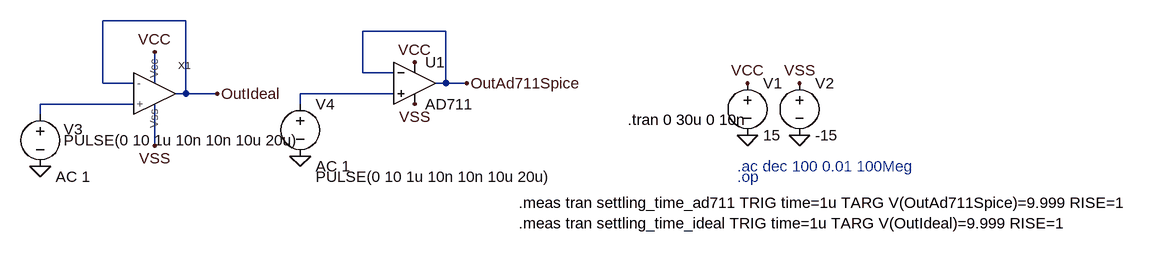
[diagram p0: schematic SettlingTime.asc]
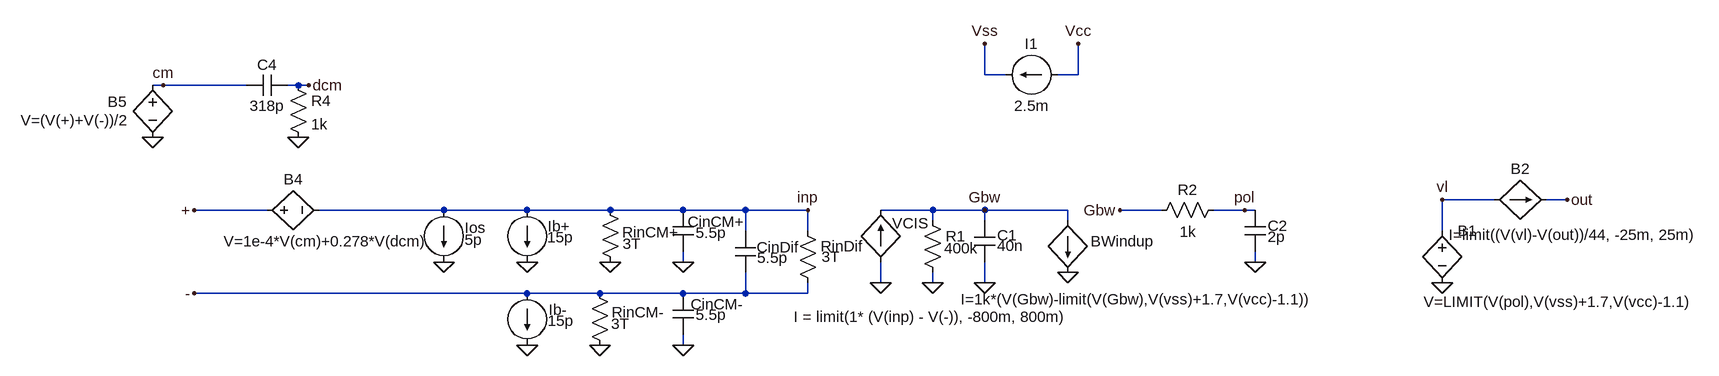
[diagram p1: sub-circuit aoideal.asc]
SettlingTime.asc, the LTspice schematic file:
Version 4.1
SHEET 1 964 680
WIRE -208 112 -336 112
WIRE 192 128 64 128
WIRE 64 192 64 128
WIRE 112 192 64 192
WIRE -336 208 -336 112
WIRE -288 208 -336 208
WIRE -256 208 -256 160
WIRE 192 208 192 128
WIRE 192 208 176 208
WIRE 224 208 192 208
WIRE -208 224 -208 112
WIRE -208 224 -224 224
WIRE -160 224 -208 224
WIRE 112 224 -32 224
WIRE -288 240 -432 240
WIRE -32 240 -32 224
WIRE -432 256 -432 240
WIRE -256 304 -256 240
FLAG 656 288 0
FLAG 736 288 0
FLAG 656 208 VCC
FLAG 736 208 VSS
FLAG 144 176 VCC
FLAG -256 160 VCC
FLAG -256 304 VSS
FLAG 144 240 VSS
FLAG -160 224 OutIdeal
FLAG 224 208 OutAd711Spice
FLAG -432 336 0
FLAG -32 320 0
SYMBOL OpAmps\\AD711 144 144 R0
SYMATTR InstName U1
SYMBOL AoIdeal -288 224 R0
SYMATTR InstName X1
SYMBOL voltage 656 192 R0
SYMATTR InstName V1
SYMATTR Value 15
SYMBOL voltage 736 192 R0
SYMATTR InstName V2
SYMATTR Value -15
SYMBOL voltage -432 240 R0
WINDOW 123 24 112 Left 2
WINDOW 39 0 0 Left 0
WINDOW 0 36 39 Left 2
WINDOW 3 36 56 Left 2
SYMATTR Value2 AC 1
SYMATTR InstName V3
SYMATTR Value PULSE(0 10 1u 10n 10n 10u 20u)
SYMBOL voltage -32 224 R0
WINDOW 123 24 112 Left 2
WINDOW 39 0 0 Left 0
WINDOW 3 24 128 Left 2
SYMATTR Value2 AC 1
SYMATTR Value PULSE(0 10 1u 10n 10n 10u 20u)
SYMATTR InstName V4
TEXT 640 352 Left 2 ;.op
TEXT 640 336 Left 2 ;.ac dec 100 0.01 100Meg
TEXT 472 264 Left 2 !.tran 0 30u 0 10n
TEXT 304 392 Left 2 !.meas tran settling_time_ad711 TRIG time=1u TARG V(OutAd711Spice)=9.999 RISE=1\n.meas tran settling_time_ideal TRIG time=1u TARG V(OutIdeal)=9.999 RISE=1

aoideal.asc, the sub-circuit schematic file:
Version 4.1
SHEET 1 2688 1516
WIRE 272 -128 272 -176
WIRE 304 -128 272 -128
WIRE 416 -128 416 -176
WIRE 416 -128 384 -128
WIRE -992 -112 -1008 -112
WIRE -864 -112 -992 -112
WIRE -784 -112 -800 -112
WIRE -768 -112 -784 -112
WIRE 1056 64 976 64
WIRE 1168 64 1136 64
WIRE -832 80 -944 80
WIRE -560 80 -752 80
WIRE -432 80 -560 80
WIRE -304 80 -432 80
WIRE -192 80 -304 80
WIRE -96 80 -192 80
WIRE 0 80 -96 80
WIRE 192 80 112 80
WIRE 272 80 192 80
WIRE 400 80 272 80
WIRE 544 80 480 80
WIRE 672 80 624 80
WIRE 688 80 672 80
WIRE 192 96 192 80
WIRE 272 96 272 80
WIRE 400 96 400 80
WIRE -96 112 -96 80
WIRE 0 112 0 80
WIRE 976 112 976 64
WIRE -192 160 -192 144
WIRE 688 160 688 144
WIRE 112 192 112 160
WIRE 192 192 192 176
WIRE 272 192 272 160
WIRE -432 208 -944 208
WIRE -320 208 -432 208
WIRE -192 208 -320 208
WIRE -96 208 -96 176
WIRE -96 208 -192 208
WIRE 0 208 0 192
WIRE 0 208 -96 208
WIRE -192 288 -192 272
FLAG 112 192 0
FLAG -944 208 -
FLAG -944 80 +
FLAG 192 192 0
FLAG 272 192 0
FLAG -192 160 0
FLAG -304 160 0
FLAG -432 160 0
FLAG -560 160 0
FLAG -432 288 0
FLAG -320 288 0
FLAG -192 288 0
FLAG 0 80 inp
FLAG 272 80 Gbw
FLAG 480 80 Gbw
FLAG 688 160 0
FLAG 672 80 pol
FLAG 976 192 0
FLAG 416 -176 Vcc
FLAG 272 -176 Vss
FLAG 1168 64 out
FLAG 400 176 0
FLAG 976 64 vl
FLAG -1008 -32 0
FLAG -992 -112 cm
FLAG -768 -112 dcm
FLAG -784 -32 0
SYMBOL bi 112 160 R180
WINDOW 0 -73 60 Left 2
WINDOW 3 -289 -84 Left 2
SYMATTR InstName VCIS
SYMATTR Value I = limit(1* (V(inp) - V(-)), -800m, 800m)
SYMBOL res 176 80 R0
WINDOW 3 34 59 Left 2
SYMATTR Value 400k
SYMATTR InstName R1
SYMBOL cap 256 96 R0
WINDOW 0 35 23 Left 2
WINDOW 3 35 39 Left 2
SYMATTR InstName C1
SYMATTR Value 40n
SYMBOL current -560 80 R0
WINDOW 0 32 27 Left 2
WINDOW 3 32 46 Left 2
SYMATTR InstName Ios
SYMATTR Value 5p
SYMBOL current -432 80 R0
WINDOW 0 32 25 Left 2
WINDOW 3 31 42 Left 2
SYMATTR InstName Ib+
SYMATTR Value 15p
SYMBOL current -432 208 R0
WINDOW 0 33 25 Left 2
WINDOW 3 32 42 Left 2
SYMATTR InstName Ib-
SYMATTR Value 15p
SYMBOL res -320 64 R0
WINDOW 0 34 50 Left 2
WINDOW 3 35 68 Left 2
SYMATTR InstName RinCM+
SYMATTR Value 3T
SYMBOL res -336 192 R0
WINDOW 0 34 45 Left 2
WINDOW 3 33 63 Left 2
SYMATTR InstName RinCM-
SYMATTR Value 3T
SYMBOL cap -208 208 R0
WINDOW 0 28 17 Left 2
WINDOW 3 35 33 Left 2
SYMATTR InstName CinCM-
SYMATTR Value 5.5p
SYMBOL cap -208 80 R0
WINDOW 0 23 18 Left 2
WINDOW 3 35 35 Left 2
SYMATTR InstName CinCM+
SYMATTR Value 5.5p
SYMBOL cap -112 112 R0
WINDOW 0 33 25 Left 2
WINDOW 3 34 41 Left 2
SYMATTR InstName CinDif
SYMATTR Value 5.5p
SYMBOL res -16 96 R0
WINDOW 3 37 56 Left 2
SYMATTR Value 3T
SYMATTR InstName RinDif
SYMBOL res 640 64 R90
WINDOW 0 0 56 VBottom 2
WINDOW 3 34 55 VTop 2
SYMATTR InstName R2
SYMATTR Value 1k
SYMBOL cap 672 80 R0
WINDOW 0 35 24 Left 2
WINDOW 3 35 41 Left 2
SYMATTR InstName C2
SYMATTR Value 2p
SYMBOL bv 976 96 R0
WINDOW 3 -29 125 Left 2
SYMATTR Value V=LIMIT(V(pol),V(vss)+1.7,V(vcc)-1.1)
SYMATTR InstName B1
SYMBOL current 384 -128 R90
WINDOW 0 -32 40 VBottom 2
WINDOW 3 32 40 VTop 2
SYMATTR InstName I1
SYMATTR Value 2.5m
SYMBOL bi 400 96 R0
WINDOW 0 35 32 Left 2
WINDOW 3 -165 121 Left 2
SYMATTR InstName BWindup
SYMATTR Value I=1k*(V(Gbw)-limit(V(Gbw),V(vss)+1.7,V(vcc)-1.1))
SYMBOL bi 1056 64 R270
WINDOW 0 32 40 VTop 2
WINDOW 3 -38 122 VBottom 2
SYMATTR InstName B2
SYMATTR Value I=limit((V(vl)-V(out))/44, -25m, 25m)
SYMBOL bv -848 80 R270
WINDOW 0 32 56 VTop 2
WINDOW 3 -32 106 VBottom 2
SYMATTR InstName B4
SYMATTR Value V=1e-4*V(cm)+0.278*V(dcm)
SYMBOL bv -1008 -128 R0
WINDOW 0 -69 41 Left 2
WINDOW 3 -203 70 Left 2
SYMATTR InstName B5
SYMATTR Value V=(V(+)+V(-))/2
SYMBOL cap -864 -96 R270
WINDOW 0 32 32 VTop 2
WINDOW 3 0 32 VBottom 2
SYMATTR InstName C4
SYMATTR Value 318p
SYMBOL res -800 -128 R0
SYMATTR InstName R4
SYMATTR Value 1k

The netlist it stands for:
* SettlingTime.asc
X§U1 N001 OutAd711Spice VCC VSS OutAd711Spice AD712  ; pins In+ In- V+ V- OUT
X§X1 OutIdeal N002 OutIdeal VCC VSS aoideal
V1 VCC 0 15
V2 VSS 0 -15
V3 N002 0 PULSE(0 10 1u 10n 10n 10u 20u) AC 1
V4 N001 0 PULSE(0 10 1u 10n 10n 10u 20u) AC 1

* block symbol definitions
.subckt aoideal - + Out Vcc Vss
B§VCIS 0 Gbw I = limit(1* (V(inp) - V(-)), -800m, 800m)
R1 Gbw 0 400k
C1 Gbw 0 40n
Ios inp 0 5p
Ib+ inp 0 15p
Ib- - 0 15p
RinCM+ inp 0 3T
RinCM- - 0 3T
CinCM- - 0 5.5p
CinCM+ inp 0 5.5p
CinDif inp - 5.5p
RinDif inp - 3T
R2 pol Gbw 1k
C2 pol 0 2p
B1 vl 0 V=LIMIT(V(pol),V(vss)+1.7,V(vcc)-1.1)
I1 Vcc Vss 2.5m
BWindup Gbw 0 I=1k*(V(Gbw)-limit(V(Gbw),V(vss)+1.7,V(vcc)-1.1))
B2 vl out I=limit((V(vl)-V(out))/44, -25m, 25m)
B4 + inp V=1e-4*V(cm)+0.278*V(dcm)
B5 cm 0 V=(V(+)+V(-))/2
C4 cm dcm 318p
R4 dcm 0 1k
.ends aoideal

* .op
* .ac dec 100 0.01 100Meg
.tran 0 30u 0 10n
.meas tran settling_time_ad711 TRIG time=1u TARG V(OutAd711Spice)=9.999 RISE=1
.meas tran settling_time_ideal TRIG time=1u TARG V(OutIdeal)=9.999 RISE=1
.lib ADI1.lib
.backanno
.end

* Results of the author's LTspice run, read from the files saved beside the schematic
* Operating Point, zero values left out:
*   V(vcc) = 15 V
*   V(vss) = -15 V
*   I(V1) = -7.399 mA
*   I(V2) = 7.399 mA
*   I(V3) = -20 pA
*   I(V4) = -25 pA
*   Ix(u1:1) = 25 pA
*   Ix(u1:2) = 25 pA
*   Ix(u1:3) = 4.899 mA
*   Ix(u1:4) = -4.899 mA
*   Ix(u1:5) = -25 pA
*   Ix(x1:+) = 20 pA
*   Ix(x1:-) = 15 pA
*   Ix(x1:out) = -15 pA
*   Ix(x1:vcc) = 2.5 mA
*   Ix(x1:vss) = -2.5 mA
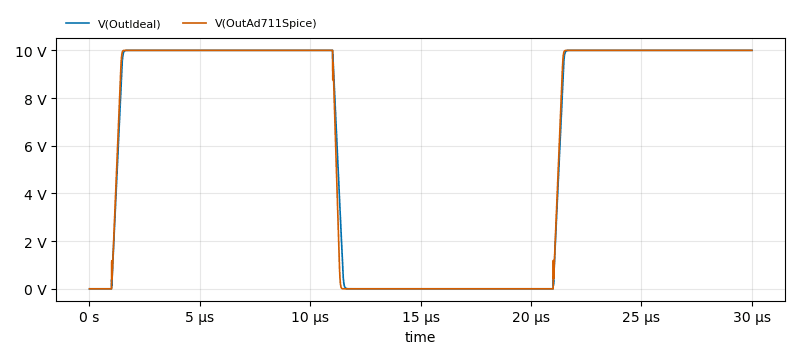
[diagram p2: Transient Analysis of SettlingTime.asc, plotted from the saved traces]
* Transient Analysis, 1 run:
*   V(OutIdeal): min 0 V, max 10 V, average 6.251 V, rms 7.853 V, last 10 V
*   V(OutAd711Spice): min 0 V, max 10 V, average 6.242 V, rms 7.856 V, last 10 V
* From the log:
*   settling_time_ad711=5.90343497455e-07 FROM 1e-06 TO 1.59034349745e-06
*   settling_time_ideal=7.14017293439e-07 FROM 1e-06 TO 1.71401729344e-06